# Altium schematic sheet Overview.SchDoc
size A4; SheetNumber: 1; SheetTotal: 5
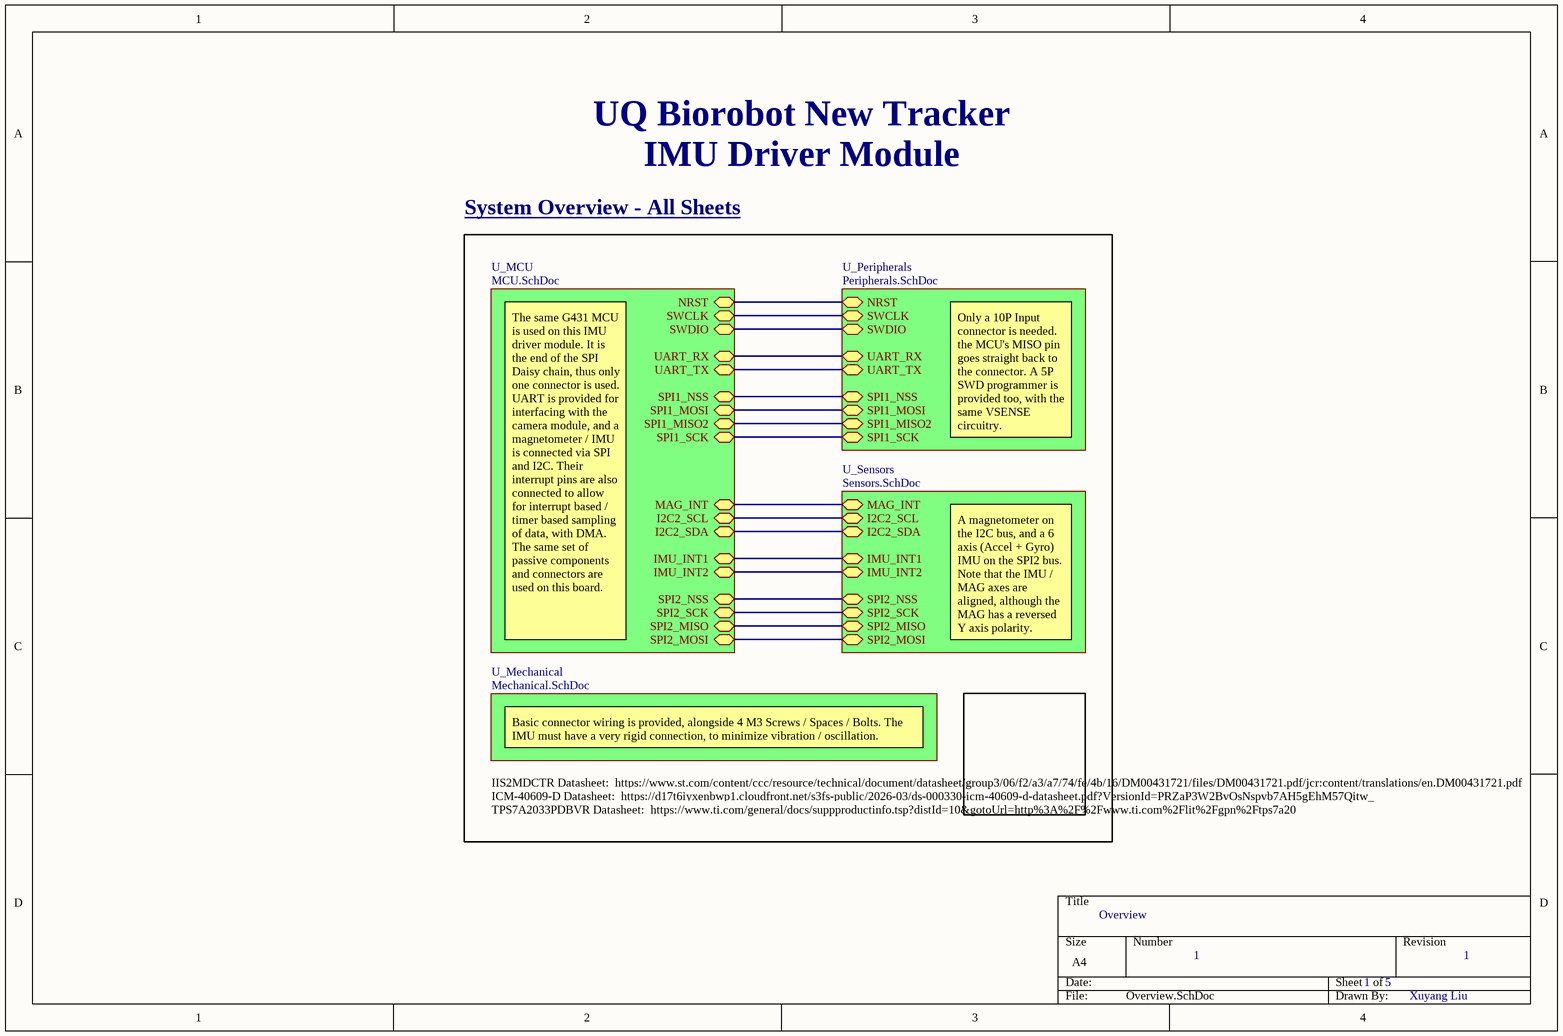
[diagram p0: Overview.SchDoc]

## Sub-sheets
U_MCU = MCU.SchDoc: NRST (bidir), SPI1_NSS (bidir), SPI1_SCK (bidir), SPI1_MOSI (bidir), I2C2_SDA (bidir), I2C2_SCL (bidir), MAG_INT (bidir), SWDIO (bidir), SWCLK (bidir), UART_TX (bidir), UART_RX (bidir), IMU_INT2 (bidir), IMU_INT1 (bidir), SPI2_NSS (bidir), SPI2_SCK (bidir), SPI2_MISO (bidir), SPI2_MOSI (bidir), SPI1_MISO2 (bidir)
U_Mechanical = Mechanical.SchDoc: no entries
U_Peripherals = Peripherals.SchDoc: SPI1_NSS (bidir), SPI1_MOSI (bidir), SPI1_MISO2 (bidir), SPI1_SCK (bidir), UART_TX (bidir), UART_RX (bidir), SWDIO (bidir), SWCLK (bidir), NRST (bidir)
U_Sensors = Sensors.SchDoc: SPI2_MISO (bidir), IMU_INT1 (bidir), SPI2_NSS (bidir), IMU_INT2 (bidir), SPI2_SCK (bidir), SPI2_MOSI (bidir), MAG_INT (bidir), I2C2_SDA (bidir), I2C2_SCL (bidir)

## Nets
(unnamed): sheet U_MCU/NRST, sheet U_Peripherals/NRST
(unnamed): sheet U_MCU/SPI1_NSS, sheet U_Peripherals/SPI1_NSS
(unnamed): sheet U_MCU/SPI1_SCK, sheet U_Peripherals/SPI1_SCK
(unnamed): sheet U_MCU/SPI1_MOSI, sheet U_Peripherals/SPI1_MOSI
(unnamed): sheet U_MCU/I2C2_SDA, sheet U_Sensors/I2C2_SDA
(unnamed): sheet U_MCU/I2C2_SCL, sheet U_Sensors/I2C2_SCL
(unnamed): sheet U_MCU/MAG_INT, sheet U_Sensors/MAG_INT
(unnamed): sheet U_MCU/SWDIO, sheet U_Peripherals/SWDIO
(unnamed): sheet U_MCU/SWCLK, sheet U_Peripherals/SWCLK
(unnamed): sheet U_MCU/UART_TX, sheet U_Peripherals/UART_TX
(unnamed): sheet U_MCU/UART_RX, sheet U_Peripherals/UART_RX
(unnamed): sheet U_MCU/IMU_INT2, sheet U_Sensors/IMU_INT2
(unnamed): sheet U_MCU/IMU_INT1, sheet U_Sensors/IMU_INT1
(unnamed): sheet U_MCU/SPI2_NSS, sheet U_Sensors/SPI2_NSS
(unnamed): sheet U_MCU/SPI2_SCK, sheet U_Sensors/SPI2_SCK
(unnamed): sheet U_MCU/SPI2_MISO, sheet U_Sensors/SPI2_MISO
(unnamed): sheet U_MCU/SPI2_MOSI, sheet U_Sensors/SPI2_MOSI
(unnamed): sheet U_MCU/SPI1_MISO2, sheet U_Peripherals/SPI1_MISO2

## Notes on the sheet
- UQ Biorobot New Tracker
- IMU Driver Module
- System Overview - All Sheets
- Only a 10P Input connector is needed. the MCU's MISO pin goes straight back to the connector. A 5P SWD programmer is provided too, with the same VSENSE circuitry.
- The same G431 MCU is used on this IMU driver module. It is the end of the SPI Daisy chain, thus only one connector is used. UART is provided for interfacing with the camera module, and a magnetometer / IMU is connected via SPI and I2C. Their interrupt pins are also connected to allow for interrupt based / timer based sampling of data, with DMA. The same set of passive components and connectors are used on this board.
- A magnetometer on the I2C bus, and a 6 axis (Accel + Gyro) IMU on the SPI2 bus. Note that the IMU / MAG axes are aligned, although the MAG has a reversed Y axis polarity.
- IIS2MDCTR Datasheet:  https://www.st.com/content/ccc/resource/technical/document/datasheet/group3/06/f2/a3/a7/74/fe/4b/16/DM00431721/files/DM00431721.pdf/jcr:content/translations/en.DM00431721.pdf
- Basic connector wiring is provided, alongside 4 M3 Screws / Spaces / Bolts. The IMU must have a very rigid connection, to minimize vibration / oscillation.
- ICM-40609-D Datasheet:  https://d17t6iyxenbwp1.cloudfront.net/s3fs-public/2026-03/ds-000330-icm-40609-d-datasheet.pdf?VersionId=PRZaP3W2BvOsNspvb7AH5gEhM57Qitw_
- TPS7A2033PDBVR Datasheet:  https://www.ti.com/general/docs/suppproductinfo.tsp?distId=10&gotoUrl=http%3A%2F%2Fwww.ti.com%2Flit%2Fgpn%2Ftps7a20
- Overview
- 1
- 1     5
- Xuyang Liu